# Altium schematic sheet DDR_and_MIO_Banks.SchDoc
size A4; SheetNumber: 9; SheetTotal: 13
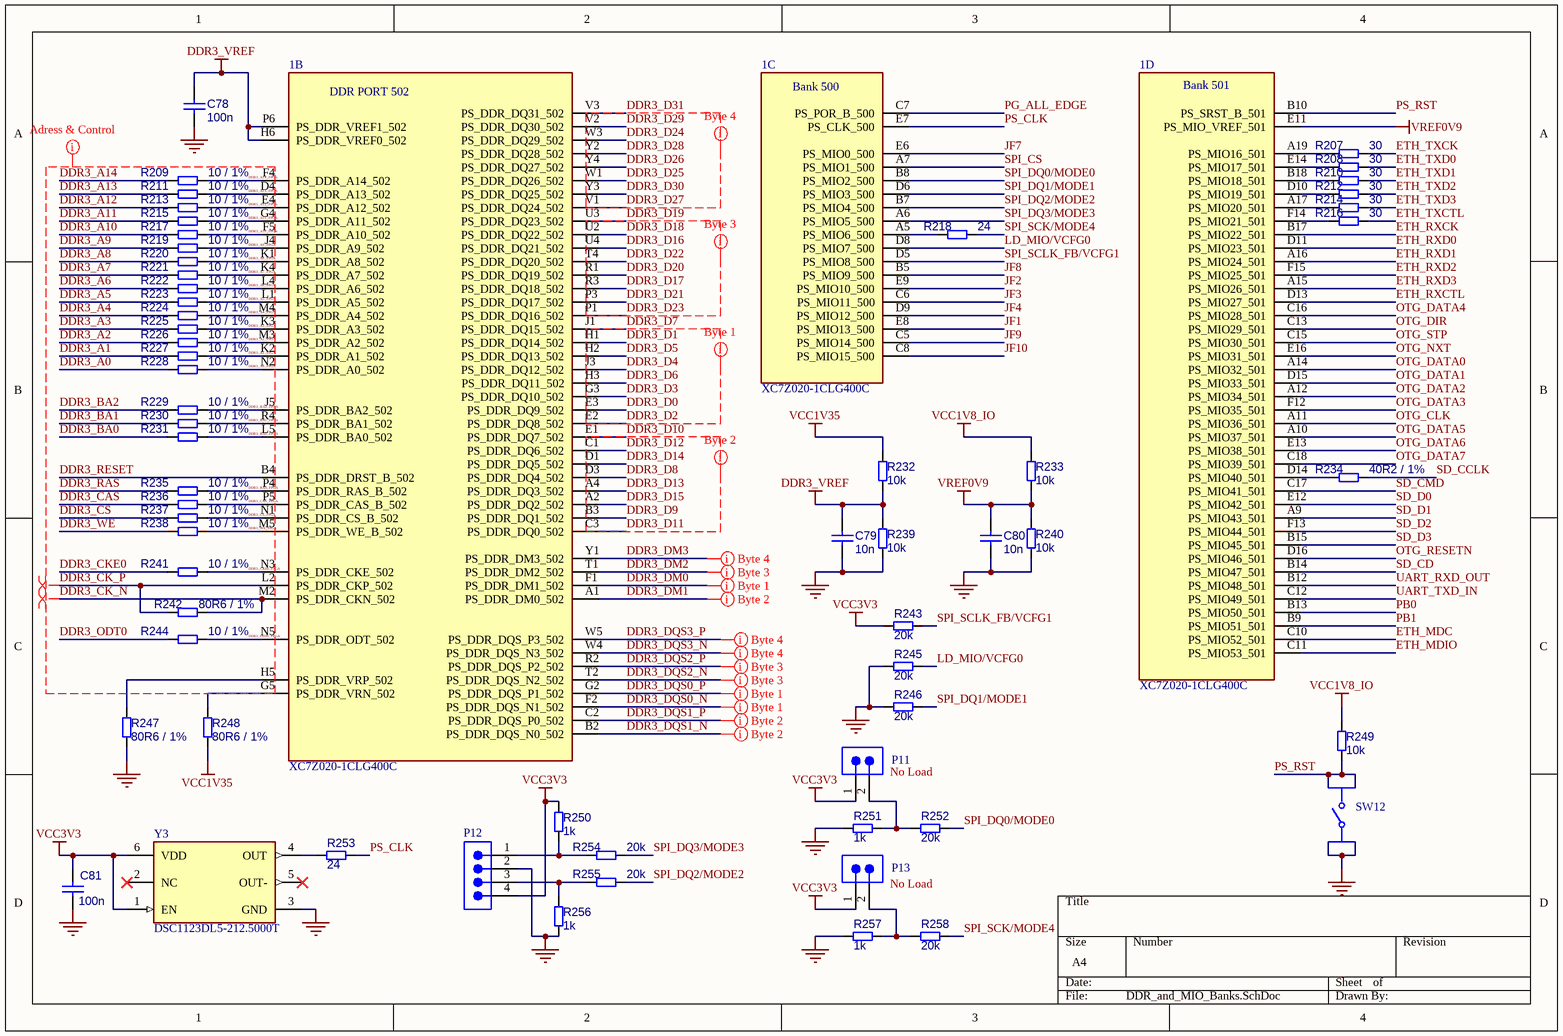
[diagram p0: DDR_and_MIO_Banks.SchDoc]

## Parts
1  XC7Z020-1CLG400C  [BGA400C80P20X20_1700X1700X160]  (parts B,C,D of 9)
C78  100n  [CAPC1005X50N_0402]
C79  10n  [CAPC1005X50N_0402]
C80  10n  [CAPC1005X50N_0402]
C81  100n  [CAPC1005X50N_0402]
P11  Male Pin Header 2x1 2.54mm  [Copy of Copy of Copy of Copy of 3M-2340-6111TG_V]  (value not drawn)
P12  Male Pin Header 1x4 2.54mm  [Copy of Copy of Copy of Copy of Copy of 3M-2340-6111TG_V]  (value not drawn)
P13  Male Pin Header 2x1 2.54mm  [Copy of Copy of Copy of Copy of 3M-2340-6111TG_V]  (value not drawn)
R207  30  [R_0402]
R208  30  [R_0402]
R209  10 / 1%  [R_0402]
R210  30  [R_0402]
R211  10 / 1%  [R_0402]
R212  30  [R_0402]
R213  10 / 1%  [R_0402]
R214  30  [R_0402]
R215  10 / 1%  [R_0402]
R216  30  [R_0402]
R217  10 / 1%  [R_0402]
R218  24  [R_0402]
R219  10 / 1%  [R_0402]
R220  10 / 1%  [R_0402]
R221  10 / 1%  [R_0402]
R222  10 / 1%  [R_0402]
R223  10 / 1%  [R_0402]
R224  10 / 1%  [R_0402]
R225  10 / 1%  [R_0402]
R226  10 / 1%  [R_0402]
R227  10 / 1%  [R_0402]
R228  10 / 1%  [R_0402]
R229  10 / 1%  [R_0402]
R230  10 / 1%  [R_0402]
R231  10 / 1%  [R_0402]
R232  10k  [R_0402]
R233  10k  [R_0402]
R234  40R2 / 1%  [R_0402]
R235  10 / 1%  [R_0402]
R236  10 / 1%  [R_0402]
R237  10 / 1%  [R_0402]
R238  10 / 1%  [R_0402]
R239  10k  [R_0402]
R240  10k  [R_0402]
R241  10 / 1%  [R_0402]
R242  80R6 / 1%  [R_0402]
R243  20k  [R_0402]
R244  10 / 1%  [R_0402]
R245  20k  [R_0402]
R246  20k  [R_0402]
R247  80R6 / 1%  [R_0402]
R248  80R6 / 1%  [R_0402]
R249  10k  [R_0402]
R250  1k  [R_0402]
R251  1k  [R_0402]
R252  20k  [R_0402]
R253  24  [R_0402]
R254  20k  [R_0402]
R255  20k  [R_0402]
R256  1k  [R_0402]
R257  1k  [R_0402]
R258  20k  [R_0402]
SW12  1301.9316.24  [FP-1301_9316_24-MFG]  (value not drawn)
Y3  DSC1123DL5-212.5000T  [FP-C04-1005-MFG]

## Nets
DDR3_VREF: 1.H6(PS_DDR_VREF0_502) 1.P6(PS_DDR_VREF1_502) C78.2 C79.2 R232.2 R239.1
GND: C78.1 C79.1 C80.1 C81.1 P12.2 R239.2 R240.2 R245.1 R246.1 R247.2 R251.1 R256.2 R257.1 SW12.3 SW12.4 Y3.3(GND)
VCC1V8_IO: R233.1 R249.2
VCC1V35: R232.1 R248.2
VCC3V3: C81.2 P11.1 P12.4 P13.1 R243.1 R250.1 Y3.1(EN) Y3.6(VDD)
VREF0V9: 1.E11(PS_MIO_VREF_501) C80.2 R233.2 R240.1
DDR3_A0: R228.2
DDR3_A0_FPGA: 1.N2(PS_DDR_A0_502) R228.1
DDR3_A1: R227.2
DDR3_A1_FPGA: 1.K2(PS_DDR_A1_502) R227.1
DDR3_A2: R226.2
DDR3_A2_FPGA: 1.M3(PS_DDR_A2_502) R226.1
DDR3_A3: R225.2
DDR3_A3_FPGA: 1.K3(PS_DDR_A3_502) R225.1
DDR3_A4: R224.2
DDR3_A4_FPGA: 1.M4(PS_DDR_A4_502) R224.1
DDR3_A5: R223.2
DDR3_A5_FPGA: 1.L1(PS_DDR_A5_502) R223.1
DDR3_A6: R222.2
DDR3_A6_FPGA: 1.L4(PS_DDR_A6_502) R222.1
DDR3_A7: R221.2
DDR3_A7_FPGA: 1.K4(PS_DDR_A7_502) R221.1
DDR3_A8: R220.2
DDR3_A8_FPGA: 1.K1(PS_DDR_A8_502) R220.1
DDR3_A9: R219.2
DDR3_A9_FPGA: 1.J4(PS_DDR_A9_502) R219.1
DDR3_A10: R217.2
DDR3_A10_FPGA: 1.F5(PS_DDR_A10_502) R217.1
DDR3_A11: R215.2
DDR3_A11_FPGA: 1.G4(PS_DDR_A11_502) R215.1
DDR3_A12: R213.2
DDR3_A12_FPGA: 1.E4(PS_DDR_A12_502) R213.1
DDR3_A13: R211.2
DDR3_A13_FPGA: 1.D4(PS_DDR_A13_502) R211.1
DDR3_A14: R209.2
DDR3_A14_FPGA: 1.F4(PS_DDR_A14_502) R209.1
DDR3_BA0: R231.2
DDR3_BA0_FPGA: 1.L5(PS_DDR_BA0_502) R231.1
DDR3_BA1: R230.2
DDR3_BA1_FPGA: 1.R4(PS_DDR_BA1_502) R230.1
DDR3_BA2: R229.2
DDR3_BA2_FPGA: 1.J5(PS_DDR_BA2_502) R229.1
DDR3_CAS: R236.2
DDR3_CAS_FPGA: 1.P5(PS_DDR_CAS_B_502) R236.1
DDR3_CK_N: 1.M2(PS_DDR_CKN_502) R242.1
DDR3_CK_P: 1.L2(PS_DDR_CKP_502) R242.2
DDR3_CKE0: R241.2
DDR3_CKE0_FPGA: 1.N3(PS_DDR_CKE_502) R241.1
DDR3_CS: R237.2
DDR3_CS_FPGA: 1.N1(PS_DDR_CS_B_502) R237.1
DDR3_D0: 1.E3(PS_DDR_DQ9_502)
DDR3_D1: 1.H1(PS_DDR_DQ14_502)
DDR3_D2: 1.E2(PS_DDR_DQ8_502)
DDR3_D3: 1.G3(PS_DDR_DQ10_502)
DDR3_D4: 1.J3(PS_DDR_DQ12_502)
DDR3_D5: 1.H2(PS_DDR_DQ13_502)
DDR3_D6: 1.H3(PS_DDR_DQ11_502)
DDR3_D7: 1.J1(PS_DDR_DQ15_502)
DDR3_D8: 1.D3(PS_DDR_DQ4_502)
DDR3_D9: 1.B3(PS_DDR_DQ1_502)
DDR3_D10: 1.E1(PS_DDR_DQ7_502)
DDR3_D11: 1.C3(PS_DDR_DQ0_502)
DDR3_D12: 1.C1(PS_DDR_DQ6_502)
DDR3_D13: 1.A4(PS_DDR_DQ3_502)
DDR3_D14: 1.D1(PS_DDR_DQ5_502)
DDR3_D15: 1.A2(PS_DDR_DQ2_502)
DDR3_D16: 1.U4(PS_DDR_DQ21_502)
DDR3_D17: 1.R3(PS_DDR_DQ18_502)
DDR3_D18: 1.U2(PS_DDR_DQ22_502)
DDR3_D19: 1.U3(PS_DDR_DQ23_502)
DDR3_D20: 1.R1(PS_DDR_DQ19_502)
DDR3_D21: 1.P3(PS_DDR_DQ17_502)
DDR3_D22: 1.T4(PS_DDR_DQ20_502)
DDR3_D23: 1.P1(PS_DDR_DQ16_502)
DDR3_D24: 1.W3(PS_DDR_DQ29_502)
DDR3_D25: 1.W1(PS_DDR_DQ26_502)
DDR3_D26: 1.Y4(PS_DDR_DQ27_502)
DDR3_D27: 1.V1(PS_DDR_DQ24_502)
DDR3_D28: 1.Y2(PS_DDR_DQ28_502)
DDR3_D29: 1.V2(PS_DDR_DQ30_502)
DDR3_D30: 1.Y3(PS_DDR_DQ25_502)
DDR3_D31: 1.V3(PS_DDR_DQ31_502)
DDR3_DM0: 1.F1(PS_DDR_DM1_502)
DDR3_DM1: 1.A1(PS_DDR_DM0_502)
DDR3_DM2: 1.T1(PS_DDR_DM2_502)
DDR3_DM3: 1.Y1(PS_DDR_DM3_502)
DDR3_DQS0_N: 1.F2(PS_DDR_DQS_N1_502)
DDR3_DQS0_P: 1.G2(PS_DDR_DQS_P1_502)
DDR3_DQS1_N: 1.B2(PS_DDR_DQS_N0_502)
DDR3_DQS1_P: 1.C2(PS_DDR_DQS_P0_502)
DDR3_DQS2_N: 1.T2(PS_DDR_DQS_N2_502)
DDR3_DQS2_P: 1.R2(PS_DDR_DQS_P2_502)
DDR3_DQS3_N: 1.W4(PS_DDR_DQS_N3_502)
DDR3_DQS3_P: 1.W5(PS_DDR_DQS_P3_502)
DDR3_ODT0: R244.2
DDR3_ODT0_FPGA: 1.N5(PS_DDR_ODT_502) R244.1
DDR3_RAS: R235.2
DDR3_RAS_FPGA: 1.P4(PS_DDR_RAS_B_502) R235.1
DDR3_RESET: 1.B4(PS_DDR_DRST_B_502)
DDR3_WE: R238.2
DDR3_WE_FPGA: 1.M5(PS_DDR_WE_B_502) R238.1
ETH_MDC: 1.C10(PS_MIO52_501)
ETH_MDIO: 1.C11(PS_MIO53_501)
ETH_RXCK: 1.B17(PS_MIO22_501)
ETH_RXCTL: 1.D13(PS_MIO27_501)
ETH_RXD0: 1.D11(PS_MIO23_501)
ETH_RXD1: 1.A16(PS_MIO24_501)
ETH_RXD2: 1.F15(PS_MIO25_501)
ETH_RXD3: 1.A15(PS_MIO26_501)
ETH_TXCK: R207.1
ETH_TXCTL: R216.1
ETH_TXD0: R208.1
ETH_TXD1: R210.1
ETH_TXD2: R212.1
ETH_TXD3: R214.1
JF1: 1.E8(PS_MIO13_500)
JF2: 1.E9(PS_MIO10_500)
JF3: 1.C6(PS_MIO11_500)
JF4: 1.D9(PS_MIO12_500)
JF7: 1.E6(PS_MIO0_500)
JF8: 1.B5(PS_MIO9_500)
JF9: 1.C5(PS_MIO14_500)
JF10: 1.C8(PS_MIO15_500)
LD_MIO/VCFG0: 1.D8(PS_MIO7_500) R245.2
OTG_CLK: 1.A11(PS_MIO36_501)
OTG_DATA0: 1.A14(PS_MIO32_501)
OTG_DATA1: 1.D15(PS_MIO33_501)
OTG_DATA2: 1.A12(PS_MIO34_501)
OTG_DATA3: 1.F12(PS_MIO35_501)
OTG_DATA4: 1.C16(PS_MIO28_501)
OTG_DATA5: 1.A10(PS_MIO37_501)
OTG_DATA6: 1.E13(PS_MIO38_501)
OTG_DATA7: 1.C18(PS_MIO39_501)
OTG_DIR: 1.C13(PS_MIO29_501)
OTG_NXT: 1.E16(PS_MIO31_501)
OTG_RESETN: 1.D16(PS_MIO46_501)
OTG_STP: 1.C15(PS_MIO30_501)
PB0: 1.B13(PS_MIO50_501)
PB1: 1.B9(PS_MIO51_501)
PG_ALL_EDGE: 1.C7(PS_POR_B_500)
PS_CLK: 1.E7(PS_CLK_500) R253.1
PS_RST: 1.B10(PS_SRST_B_501) R249.1 SW12.1 SW12.2
SD_CCLK: R234.1
SD_CD: 1.B14(PS_MIO47_501)
SD_CMD: 1.C17(PS_MIO41_501)
SD_D0: 1.E12(PS_MIO42_501)
SD_D1: 1.A9(PS_MIO43_501)
SD_D2: 1.F13(PS_MIO44_501)
SD_D3: 1.B15(PS_MIO45_501)
SPI_CS: 1.A7(PS_MIO1_500)
SPI_DQ0/MODE0: 1.B8(PS_MIO2_500) R252.2
SPI_DQ1/MODE1: 1.D6(PS_MIO3_500) R246.2
SPI_DQ2/MODE2: 1.B7(PS_MIO4_500) R255.2
SPI_DQ3/MODE3: 1.A6(PS_MIO5_500) R254.2
SPI_SCK/MODE4: R218.1 R258.2
SPI_SCLK_FB/VCFG1: 1.D5(PS_MIO8_500) R243.2
UART_RXD_OUT: 1.B12(PS_MIO48_501)
UART_TXD_IN: 1.C12(PS_MIO49_501)
Net1_A5: 1.A5(PS_MIO6_500) R218.2
Net1_A17: 1.A17(PS_MIO20_501) R214.2
Net1_A19: 1.A19(PS_MIO16_501) R207.2
Net1_B18: 1.B18(PS_MIO18_501) R210.2
Net1_D10: 1.D10(PS_MIO19_501) R212.2
Net1_D14: 1.D14(PS_MIO40_501) R234.2
Net1_E14: 1.E14(PS_MIO17_501) R208.2
Net1_F14: 1.F14(PS_MIO21_501) R216.2
Net1_G5: 1.G5(PS_DDR_VRN_502) R248.1
Net1_H5: 1.H5(PS_DDR_VRP_502) R247.1
NetP11_2: P11.2 R251.2 R252.1
NetP12_1: P12.1 R250.2 R254.1
NetP12_3: P12.3 R255.1 R256.1
NetP13_2: P13.2 R257.2 R258.1
NetR253_2: R253.2 Y3.4(OUT)

Not connected (* = marked no-connect by the designer): Y3 2(NC)* 5(OUT-)*

## Layout directives
differential pair: DDR3_CK_N, DDR3_CK_P
net class DDR_B4_D: DDR3_D24, DDR3_D25, DDR3_D26, DDR3_D27, DDR3_D28, DDR3_D29, DDR3_D30, DDR3_D31, DDR3_DM3, DDR3_DQS3_N, DDR3_DQS3_P
net class DDR_B3_D: DDR3_D16, DDR3_D17, DDR3_D18, DDR3_D19, DDR3_D20, DDR3_D21, DDR3_D22, DDR3_D23, DDR3_DM2, DDR3_DQS2_N, DDR3_DQS2_P
net class DDR_B1_D: DDR3_D0, DDR3_D1, DDR3_D2, DDR3_D3, DDR3_D4, DDR3_D5, DDR3_D6, DDR3_D7, DDR3_DM0, DDR3_DQS0_N, DDR3_DQS0_P
net class DDR_B2_D: DDR3_D8, DDR3_D9, DDR3_D10, DDR3_D11, DDR3_D12, DDR3_D13, DDR3_D14, DDR3_D15, DDR3_DM1, DDR3_DQS1_N, DDR3_DQS1_P
net class DDR_ADR_CTRL: DDR3_A0, DDR3_A0_FPGA, DDR3_A1, DDR3_A1_FPGA, DDR3_A2, DDR3_A2_FPGA, DDR3_A3, DDR3_A3_FPGA, DDR3_A4, DDR3_A4_FPGA, DDR3_A5, DDR3_A5_FPGA, DDR3_A6, DDR3_A6_FPGA, DDR3_A7, DDR3_A7_FPGA, DDR3_A8, DDR3_A8_FPGA, DDR3_A9, DDR3_A9_FPGA, DDR3_A10, DDR3_A10_FPGA, DDR3_A11, DDR3_A11_FPGA, DDR3_A12, DDR3_A12_FPGA, DDR3_A13, DDR3_A13_FPGA, DDR3_A14, DDR3_A14_FPGA, DDR3_BA0, DDR3_BA0_FPGA, DDR3_BA1, DDR3_BA1_FPGA, DDR3_BA2, DDR3_BA2_FPGA, DDR3_CAS, DDR3_CAS_FPGA, DDR3_CK_N, DDR3_CK_P, DDR3_CKE0, DDR3_CKE0_FPGA, DDR3_CS, DDR3_CS_FPGA, DDR3_ODT0, DDR3_ODT0_FPGA, DDR3_RAS, DDR3_RAS_FPGA, DDR3_RESET, DDR3_WE, DDR3_WE_FPGA

## Notes on the sheet
- (near P11) No Load
- (near P13) No Load
- (in symbol XC7Z020-1CLG400C, part B) DDR PORT 502
- (in symbol XC7Z020-1CLG400C, part C) Bank 500
- (in symbol XC7Z020-1CLG400C, part D) Bank 501

## Library data of the parts
1 = XC7Z020-1CLG400C: Integrated Circuit; Manufacturer_Name: AMD; Datasheet Link: http://www.xilinx.com/support/documentation/data_sheets/ds190-Zynq-7000-Overview.pdf; Height: 1.6mm; Manufacturer_Part_Number: XC7Z020-1CLG400C; Mouser Part Number: 217-XC7Z020-1CLG400C; Mouser Price/Stock: https://www.mouser.co.uk/ProductDetail/AMD-Xilinx/XC7Z020-1CLG400C?qs=rrS6PyfT74eaxuOsP%2FGL4g%3D%3D
C78-C81 = CMP-001-00084-2: MLCC 0402
P11 P13 = CMP-002-00078-1: Male Header, Pitch 2.54 mm, 2x 1 Position, Height 8.636 mm, Tail Length 3.05 mm, -55 to 105 degC, RoHS, Bulk; Manufacturer: 3M; Max Current Rating: 3A; Rows: 1; Gender: Male; Max Operating Temperature: 105°C; Contact Finish: Gold; Datasheet URL: https://datasheet.ciiva.com/5161/ts0766-242217-5161112.pdf; Pins: 40; Package Description: Male Header, Pitch 2.54 mm, 1 x 40 Position, Height 8.636 mm, Tail Length 3.05 mm; Contact Material: Copper; Package Reference: 2340-6111TG; Package Quantity: 200; Current Rating: 3A; Datasheet Version: Aug-08; Min Operating Temperature: -55°C; Connector Type: Header; Contact Plating: Gold; Case/Package: 2340-6111TG; Packaging: Bulk; RoHS Compliant: True; Manufacturer URL: http://www.3m.com/; Lead Pitch: 0.1inch; Colour: Black; Mounting Technology: TH
P12 = CMP-002-00081-1: Male Header, Pitch 2.54 mm, 1x4 Position, Height 8.636 mm, Tail Length 3.05 mm, -55 to 105 degC, RoHS, Bulk; Manufacturer: 3M; Current Rating: 3A; Rows: 1; Max Operating Temperature: 105°C; Connector Type: Header; Datasheet Version: Aug-08; Min Operating Temperature: -55°C; Manufacturer URL: http://www.3m.com/; Package Description: Male Header, Pitch 2.54 mm, 1 x 40 Position, Height 8.636 mm, Tail Length 3.05 mm; Datasheet URL: https://datasheet.ciiva.com/5161/ts0766-242217-5161112.pdf; Case/Package: 2340-6111TG; Contact Plating: Gold; Contact Material: Copper; Packaging: Bulk; RoHS Compliant: True; Gender: Male; Lead Pitch: 0.1inch; Pins: 40; Package Reference: 2340-6111TG; Package Quantity: 200; Max Current Rating: 3A; Mounting Technology: TH; Contact Finish: Gold; Colour: Black
R207-R258 = CMP-009-00178-3: Chip 0402 resistor
SW12 = CMP-00030-00001-1: Switch Tactile N.O. SPST Round Button Gull Wing 0.05A 12VDC >100000Cycles 1.6N SMD T/R; Max Operating Temperature: 70°C; Case/Package: SMD/SMT; Mounting Technology: Surface Mount; Min Operating Temperature: -20°C
Y3 = CMP-06255-000108-1: MEMS OSC XO 212.5000MHZ LVDS SMD; Frequency: 212.5MHz; Max Supply Current: 32mA; Frequency Stability: 10ppm; Series: DSC1123; Ratings: AEC-Q100; Min Operating Temperature: -40°C; Length: 0.098inch; Case/Package: SMD/SMT; Height: 0.035inch; Max Operating Temperature: 105°C; Width: 0.079inch; Packaging: Tape and Reel; Mount: Surface Mount